# Altium schematic sheet Sheet1.SchDoc
size C; SheetNumber: 1; SheetTotal: 2; SPICEModelCacheYWQRXGOI: <root> / <DocumentId>YWQRXGOI</DocumentId> / </root>
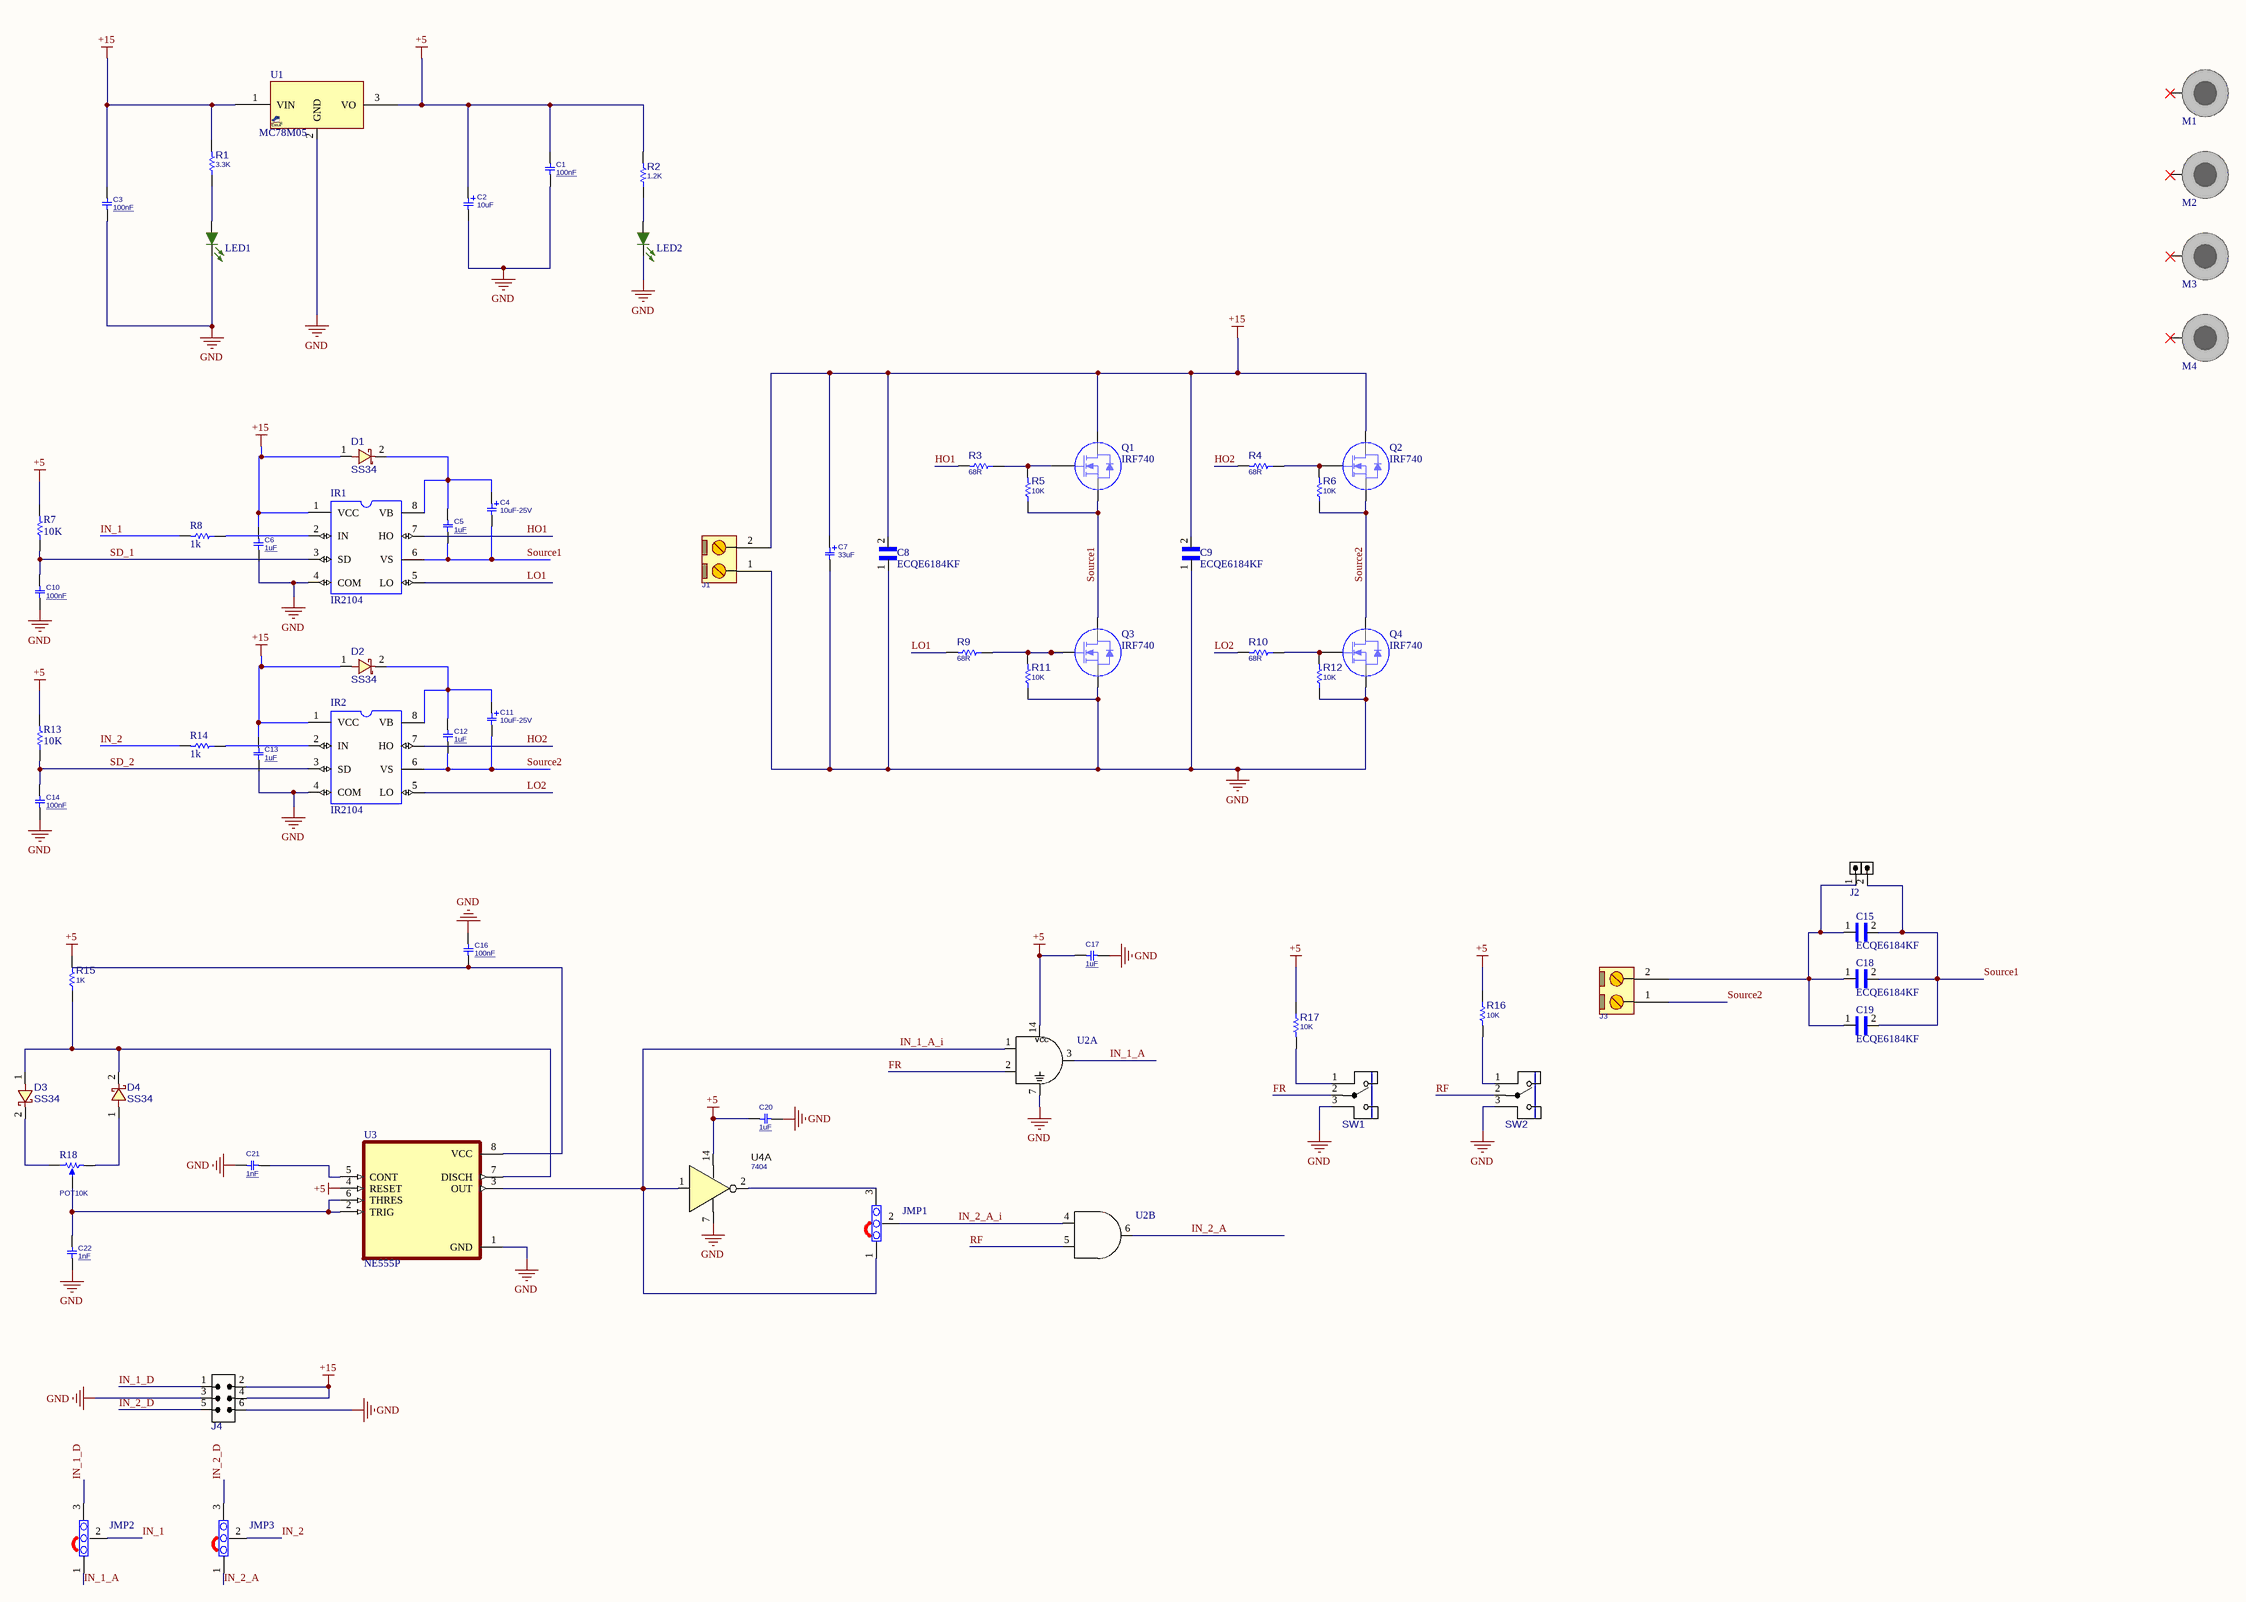
[diagram p0: Sheet1.SchDoc]

## Parts
C1  100nF  [C1206]
C2  10uF  [C_TN_6032]
C3  100nF  [C1206]
C4  10uF-25V  [C_TN_3528]
C5  1uF  [C1206]
C6  1uF  [C1206]
C7  33uF  [C_TN_6032]
C8  ECQE6184KF  [CAPRR1500W80L1850T800H1600]
C9  ECQE6184KF  [CAPRR1500W80L1850T800H1600]
C10  100nF  [C1206]
C11  10uF-25V  [C_TN_3528]
C12  1uF  [C1206]
C13  1uF  [C1206]
C14  100nF  [C1206]
C15  ECQE6184KF  [CAPRR1500W80L1850T800H1600]
C16  100nF  [C1206]
C17  1uF  [C1206]
C18  ECQE6184KF  [CAPRR1500W80L1850T800H1600]
C19  ECQE6184KF  [CAPRR1500W80L1850T800H1600]
C20  1uF  [C1206]
C21  1nF  [C0402]
C22  1nF  [c1206]
D1  SS34  [D_SMB]
D2  SS34  [D_SMB]
D3  SS34  [D_SMB]
D4  SS34  [D_SMB]
IR1  IR2104  [8P3]
IR2  IR2104  [8P3]
J1  CONN_TB2  [MSTB_2]  (value not drawn)
J2  HDRM2  [HDR_M_1X2]  (value not drawn)
J3  CONN_TB2  [MSTB_2]  (value not drawn)
J4  IDC_2X3  [IDC_2X3]  (value not drawn)
JMP1  Jumper 3 Pin  [Jumper 3]  (value not drawn)
JMP2  Jumper 3 Pin  [Jumper 3]  (value not drawn)
JMP3  Jumper 3 Pin  [Jumper 3]  (value not drawn)
LED1  LED SMD 1206 GREEN  [LED 1206 @]  (value not drawn)
LED2  LED SMD 1206 GREEN  [LED 1206 @]  (value not drawn)
M1  DNP/MH  [SCMH_M3]  (value not drawn)  (no BOM)
M2  DNP/MH  [SCMH_M3]  (value not drawn)  (no BOM)
M3  DNP/MH  [SCMH_M3]  (value not drawn)  (no BOM)
M4  DNP/MH  [SCMH_M3]  (value not drawn)  (no BOM)
Q1  IRF740  [TO-220 AB]
Q2  IRF740  [TO-220 AB]
Q3  IRF740  [TO-220 AB]
Q4  IRF740  [TO-220 AB]
R1  3.3K  [R1206]
R2  1.2K  [R1206]
R3  68R  [R1206]
R4  68R  [R1206]
R5  10K  [R1206]
R6  10K  [R1206]
R7  10K  [RESC4817X04N]
R8  1k  [RESC4817X04N]
R9  68R  [R1206]
R10  68R  [R1206]
R11  10K  [R1206]
R12  10K  [R1206]
R13  10K  [RESC4817X04N]
R14  1k  [RESC4817X04N]
R15  1K  [R1206]
R16  10K  [R1206]
R17  10K  [R1206]
R18  POT10K  [VOL_R]
SW1  ToggleSwitch  [SWTOG_SPDT_S_7101SY]  (value not drawn)
SW2  ToggleSwitch  [SWTOG_SPDT_S_7101SY]  (value not drawn)
U1  MC78M05  [TO220_3]
U2  SN7408  [DIP_14]  (value not drawn)  (parts A,B of 4)
U3  NE555P  [SO_8]
U4  7404  [SO_14]  (part A of 6)

## Nets
+5: C1.2 C2.1 C17.2 C20.2 R2.2 R7.2 R13.2 R15.2 R16.1 R17.1 U1.3(VO) U2.14(VCC) U3.4(RESET) U4.14(VCC)
+15: C3.2 C6.2 C7.1 C8.2 C9.2 C13.2 D1.1 D2.1 IR1.1(VCC) IR2.1(VCC) J1.2 J4.2 J4.4 Q1.2(D) Q2.2(D) R1.2 U1.1(VIN)
GND: C1.1 C2.2 C3.1 C6.1 C7.2 C8.1 C9.1 C10.1 C13.1 C14.1 C16.1 C17.1 C20.1 C21.1 C22.1 IR1.4(COM) IR2.4(COM) J1.1 J4.3 J4.6 LED1.2(K) LED2.2(K) Q3.3(S) Q4.3(S) R11.1 R12.1 SW1.3(T2) SW2.3(T2) U1.2(GND) U2.7(GND) U3.1(GND) U4.7(GND)
FR: SW1.2(COM) U2.2
HO1: IR1.7(HO) R3.2
HO2: IR2.7(HO) R4.2
IN_1: JMP2.2 R8.2
IN_1_A: JMP2.1 U2.3
IN_1_A_i: JMP1.1 U2.1 U3.3(OUT) U4.1(1A)
IN_1_D: J4.1 JMP2.3
IN_2: JMP3.2 R14.2
IN_2_A: JMP3.1 U2.6
IN_2_A_i: JMP1.2 U2.4
IN_2_D: J4.5 JMP3.3
LO1: IR1.5(LO) R9.2
LO2: IR2.5(LO) R10.2
RF: SW2.2(COM) U2.5
SD_1: C10.2 IR1.3(SD) R7.1
SD_2: C14.2 IR2.3(SD) R13.1
Source1: C4.2 C5.1 C15.2 C18.2 C19.2 IR1.6(VS) J2.2 Q1.3(S) Q3.2(D) R5.1
Source2: C11.2 C12.1 IR2.6(VS) J3.1 Q2.3(S) Q4.2(D) R6.1
NetC4_1: C4.1 C5.2 D1.2 IR1.8(VB)
NetC11_1: C11.1 C12.2 D2.2 IR2.8(VB)
NetC15_1: C15.1 C18.1 C19.1 J2.1 J3.2
NetC16_2: C16.2 U3.8(VCC)
NetC21_2: C21.2 U3.5(CONT)
NetC22_2: C22.2 R18.2(TAP) U3.2(TRIG) U3.6(THRES)
NetD3_1: D3.1 D4.2 R15.1 U3.7(DISCH)
NetD3_2: D3.2 R18.1(TOP)
NetD4_1: D4.1 R18.3(BOT)
NetIR1_2: IR1.2(IN) R8.1
NetIR2_2: IR2.2(IN) R14.1
NetJMP1_3: JMP1.3 U4.2(1Y)
NetLED1_1: LED1.1(A) R1.1
NetLED2_1: LED2.1(A) R2.1
NetQ1_1: Q1.1(G) R3.1 R5.2
NetQ2_1: Q2.1(G) R4.1 R6.2
NetQ3_1: Q3.1(G) R9.1 R11.2
NetQ4_1: Q4.1(G) R10.1 R12.2
NetR16_2: R16.2 SW2.1(T1)
NetR17_2: R17.2 SW1.1(T1)

Not connected (* = marked no-connect by the designer): M1 1*; M2 1*; M3 1*; M4 1*

## Library data of the parts
C1 C3 = CAP_SMD_MLCC_1206: CAP, MLCC, -F, -V, MATERIAL, -%, 0201; PARAM: -, -%; MANF_P#: MANF_PART#; PRICE: 100= 1$; MANF: -; PARAM2: -V; ASSEMBLY: ASSEMBLY; VALUE: 100nF
C2 C7 = CAP_SMD_TAN_6032: CAP, SMD, TAN,; PARAM2: -V
  C2: VALUE: 10uF
  C7: VALUE: 33uF
C4 C11 = CAP_SMD_TAN: CAP, SMD, TAN,; PARAM: 25V; VALUE: 10uF-25V
C5 C6 C10 C12-C14 C16 C17 C20-C22 = CAP_SMD_MLCC: CAP, MLCC, 1nF, 50V, C0G, 10%, 0402; MANF_P#: MANF_PART#; MANF: Murata; PARAM: C0G, 10%; PRICE: 100= 1$; DESC: CAP, MLCC, 1nF, 50V, C0G, 10%, 0402; PARAM2: 50V; ASSEMBLY: ASSEMBLY
  C5 C6 C12 C13 C17 C20: VALUE: 1uF
  C10 C14 C16: VALUE: 100nF
  C21 C22: VALUE: 1nF
D1-D4 = DIODE_SMD_SCHOTTKY_SS34: DIODE, SCHOTTKY, 40V, 3A; MANF: VISHAY; DESC: DESCRIPTION; PARAM: 20V; MANF_P#: SS34; ASSEMBLY: ASSEMBLY; PRICE: PRICE; PARAM2: 3A; VALUE: SS34
IR1 IR2 = IR2104S: Half-Bridge Gate Driver IC Non-Inverting; MF: Infineon Technologies; SnapEDA_Link: https://www.snapeda.com/parts/IR2104S/Infineon%20Technologies/view-part/582439/?ref=snap; Package: SO-8 Infineon; MP: IR2104S; Price: None; Value: *; Availability: Unavailable
J1 J3 = CONN_MSTB_2: CONN, PHOENIX MSTB, 5-G, 5.08mm pitch; PARAM2: 320V; PARAM: 12A; VALUE: CONN_TB2
J2 = HDR_M_1X2: CONN, HEADER, Male, pitch: 2.54mm, 2POS; VALUE: HDRM2
J4 = IDC_2X3: CONN, IDC, Male, pitch: 2.54mm, 6POS; VALUE: IDC_2X3
JMP1-JMP3 = Jumper 3 Pin: Desc: 2.54 mm; Value: 1*3; Category: Pin-Header; Package: Jumper
LED1 LED2 = LED SMD 1206 GREEN: Code Anbar: h.k; Category: LED
M1-M4 = SCMH_M3: SCREW mouting, M3, 3.0mm diameter and 6.0mm PanHead; ASSEMBLY: DNP; VALUE: DNP/MH
Q1-Q4 = IRF740: MOSFET N-CH 400V 10A TO-220AB; Published: 2017-1-12; DatasheetVersion: 2017-1-12; PackageVersion: 2017-1-12; PackageReference: TO-220AB; Publisher: Abbas Basereh; PackageDescription: MOSFET N-CH 400V 10A TO-220AB; ComponentLink1Description: http://www.digikey.com/products/en/discrete-semiconductor-products/19; ComponentLink1URL: http://www.digikey.com/product-detail/en/vishay-siliconix/IRF740PBF/IRF740PBF-ND/812037; ComponentLink2Description: Datasheet; ComponentLink2URL: http://www.roboeq.ir/files/id/1101/name/IRF740A.pdf
R1-R6 R9-R12 R15-R17 = RES_SMD_1206: RESISTOR, SMD; PARAM: -W; DESC: DESCRIPTION; DIST#: MOUSER; PARAM2: 1%; MANF_P#: -; MANF: -; ASSEMBLY: ASSEMBLY; PRICE: 100= 0.5$
  R1: VALUE: 3.3K
  R2: VALUE: 1.2K
  R3 R4 R9 R10: VALUE: 68R
  R5 R6 R11 R12 R16 R17: VALUE: 10K
  R15: VALUE: 1K
R7 R8 R13 R14 = RES 1206 0.25W: RES 1206; Designer: Abbas Basereh; Desc.: RES SMD 1206; Data: 16-12-2016
R18 = RES_THD_POT_VOLUME: RESISTOR, THD, Potentiometer Volume; VALUE: POT10K
SW1 SW2 = SWTOG_SPDT_S_7101SY: SWITCH, TOGGLE, SPDT, THD; MANF_PART#: 7101SYZBE; MANF: C&K; PARAM: 20VAC, 5A; DESC: DESCRIPTION; VALUE: ToggleSwitch; ASSEMBLY: ASSEMBLY; PRICE: 4.5$
U1 = VREG_78M05_TO220: REG, Linear, Fixed, 5v, 1.5A, TO-220; MANF_P#: LM78M05CT, LM7805CT, LM7805ACT, UA7805CKC, L7805ABV, L7805ACV, L7805CV, L78M05CV, KA78T05, KA7805ETU, MC78M05BT, MC78M05CT, MC7805ACT, MC7805ABT, NCP7805TG, NJM7805FA, TS7805CZ; MANF: TI, ST, FAIRCHILD, ON, NJR, TS; PARAM: 5v, 1.5A; PARAM2: PARAM2; VALUE: MC78M05
U2 = ANDx4_SN7408_DIP: Gate, AND, Quad 2 Input; MANF: Texas Instruments; MANF_P#: SN74LS08N; Value: SN7408
U4 = NOTx6_SN74HC04_SOP14: Inverter IC Logic-level 6 section SOP-14 SMD; MANF: Texas Instruments; MANF_P#: SN74HC04NSR; PARAM2: 2 V ~ 6 V; PARAM: 5.2mA, 5.2mA; VALUE: 7404
C8 C9 C15 C18 C19 = ECQE6184KF: Value: *; MP: ECQE6184KF; Package: None; Availability: Unavailable; Price: None
U3 = NE555P: Package: None; Price: None; Value: *; MP: NE555P; Availability: Unavailable